# Altium schematic sheet Gear Trak.SchDoc
size A2
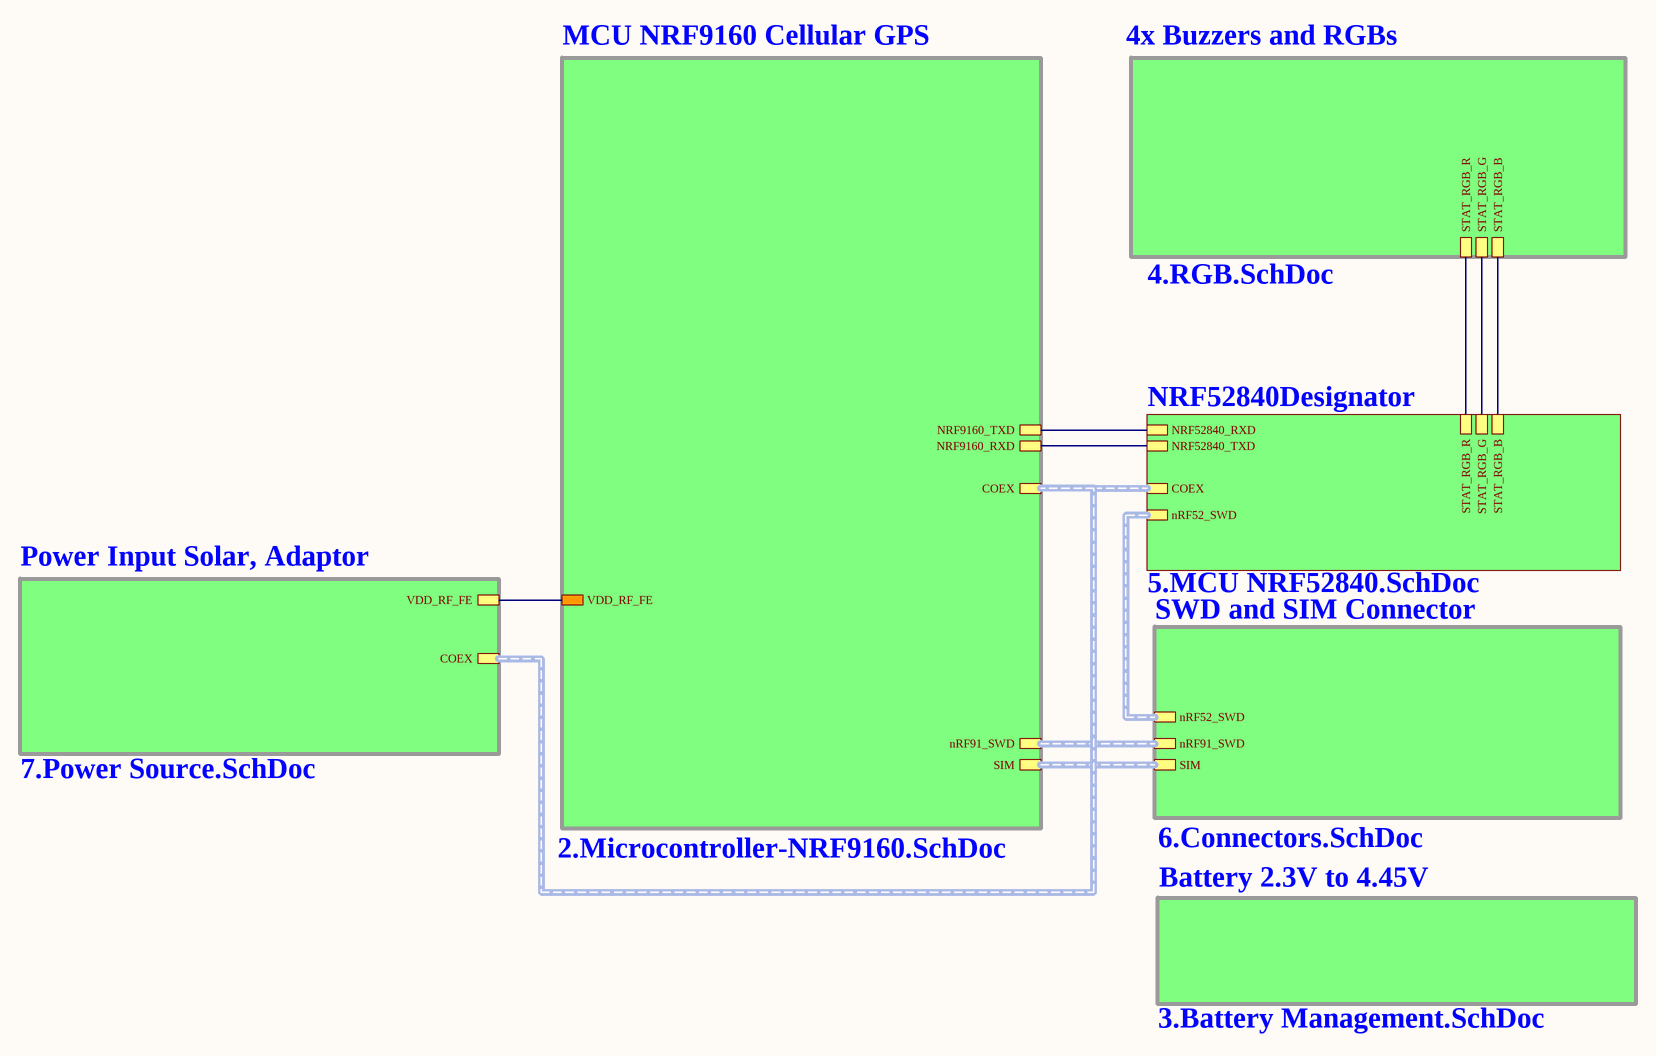
[diagram p0: Gear Trak.SchDoc]

## Sub-sheets
4x Buzzers and RGBs = 4.RGB.SchDoc: STAT_RGB_R, STAT_RGB_B, STAT_RGB_G
Battery 2.3V to 4.45V = 3.Battery Management.SchDoc: no entries
MCU NRF9160 Cellular GPS = 2.Microcontroller-NRF9160.SchDoc: nRF91_SWD (harness SWD), SIM (harness SIM), VDD_RF_FE, COEX (harness COEX), NRF9160_RXD, NRF9160_TXD
NRF52840Designator = 5.MCU NRF52840.SchDoc: COEX (harness COEX), nRF52_SWD (harness SWD), NRF52840_RXD, NRF52840_TXD, STAT_RGB_R, STAT_RGB_G, STAT_RGB_B
Power Input Solar, Adaptor = 7.Power Source.SchDoc: COEX (harness COEX), VDD_RF_FE
SWD and SIM Connector = 6.Connectors.SchDoc: SIM (harness SIM), nRF91_SWD (harness SWD), nRF52_SWD (harness SWD)

## Nets
(unnamed): sheet MCU NRF9160 Cellular GPS/VDD_RF_FE, sheet Power Input Solar, Adaptor/VDD_RF_FE
(unnamed): sheet MCU NRF9160 Cellular GPS/NRF9160_RXD, sheet NRF52840Designator/NRF52840_TXD
(unnamed): sheet MCU NRF9160 Cellular GPS/NRF9160_TXD, sheet NRF52840Designator/NRF52840_RXD
(unnamed): sheet 4x Buzzers and RGBs/STAT_RGB_R, sheet NRF52840Designator/STAT_RGB_R
(unnamed): sheet 4x Buzzers and RGBs/STAT_RGB_B, sheet NRF52840Designator/STAT_RGB_B
(unnamed): sheet 4x Buzzers and RGBs/STAT_RGB_G, sheet NRF52840Designator/STAT_RGB_G

## Buses and harness runs
harness sheet MCU NRF9160 Cellular GPS/COEX = sheet NRF52840Designator/COEX = sheet Power Input Solar, Adaptor/COEX
harness sheet MCU NRF9160 Cellular GPS/nRF91_SWD = sheet SWD and SIM Connector/nRF91_SWD
harness sheet MCU NRF9160 Cellular GPS/SIM = sheet SWD and SIM Connector/SIM
harness sheet NRF52840Designator/nRF52_SWD = sheet SWD and SIM Connector/nRF52_SWD